# Altium schematic sheet Schematic.SchDoc
size A4; DrawnBy: Matthew Tang; Revision: 0.3; SheetNumber: 1; SheetTotal: 1; Time: Buck IC Converter Schematic
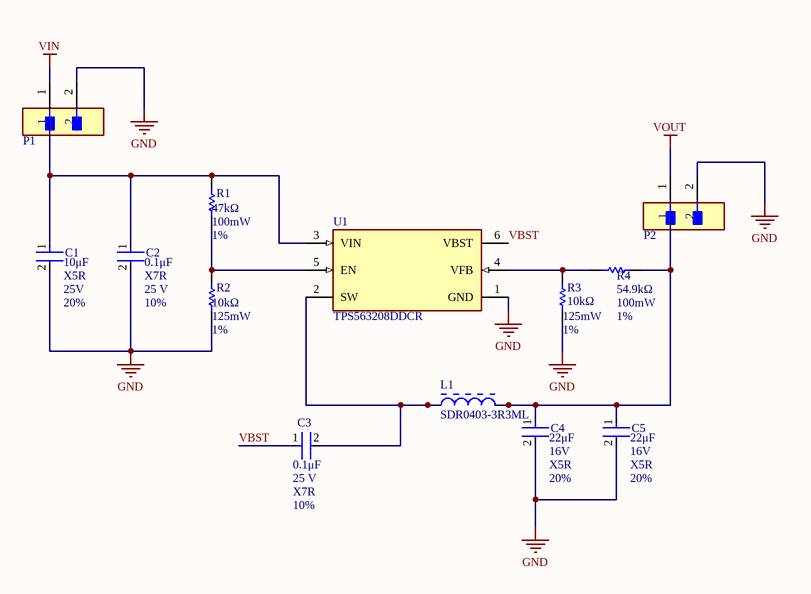
[diagram p0: Schematic.SchDoc]

## Parts
C1  10μF  Tolerance: 20%  Voltage: 25V  Dielectric: X5R  [FP-GRM188-0_2-MFG]
C2  0.1μF  Voltage Rating: 25 V  Temperature Characteristic: X7R  Tolerance: 10%  [FP-C0603C-CF-MFG]
C3  0.1μF  Voltage Rating: 25 V  Temperature Characteristic: X7R  Tolerance: 10%  [FP-C0603C-CF-MFG]
C4  22μF  Voltage Rating: 16V  Tolerance: 20%  Temperature Characteristic: X5R  [FP-CL10-IPC_B]
C5  22μF  Voltage Rating: 16V  Tolerance: 20%  Temperature Characteristic: X5R  [FP-CL10-IPC_B]
L1  SDR0403-3R3ML  [BOUR-SDR0403-2_V]
P1  (no value)  [FP-216571-1002-MFG]
P2  (no value)  [FP-216571-1002-MFG]
R1  47kΩ  Power: 100mW  Tolerance: 1%  [RESC1609X50X30NL8T20]
R2  10kΩ  Power: 125mW  Tolerance: 1%  [RESC1609X50X30NL8T20]
R3  10kΩ  Power: 125mW  Tolerance: 1%  [RESC1609X50X30NL8T20]
R4  54.9kΩ  Power: 100mW  Tolerance: 1%  [RESC1609X50X30NL8T20]
U1  TPS563208DDCR  [FP-DDC0006A-MFG]

## Nets
GND: C1.2 C2.2 C4.2 C5.2 P1.2 P2.2 R2.1 R3.1 U1.1(GND)
VIN: P1.1
VOUT: P2.1
VBST: C3.1 U1.6(VBST)
NetC1_1: C1.1 C2.1 R1.2 U1.3(VIN)
NetC3_2: C3.2 L1.1 U1.2(SW)
NetC4_1: C4.1 C5.1 L1.2 R4.1
NetR1_1: R1.1 R2.2 U1.5(EN)
NetR3_2: R3.2 R4.2 U1.4(VFB)

## Library data of the parts
C1 = CMP-2006-02520-2: Chip Multilayer Ceramic Capacitors for General Purpose, 0603, 10uF, X5R, 15%, 20%, 25V; Resistor Type: Ceramic; Max Operating Temperature: 85°C; Min Operating Temperature: -55°C; Lead Free: Lead Free; REACH SVHC: No SVHC; Case/Package: 0603; Mount: Surface Mount; Voltage Rating (DC): 25V; Height: 0.8mm; Length: 1.6mm; Thickness: 0.031inch; Width: 0.031inch; Termination: SMD/SMT; Case Code (Imperial): 0603; Case Code (Metric): 1608; Package Quantity: 1; Packaging: Tape and Reel; Depth: 0.8mm; Voltage Rating: 25V; Weight: 0.000222oz; Number of Pins: 2
C2 C3 = CMP-2006-03057-2: CAP CER 0.1UF 25V X7R 0603; Manufacturer Part Number: C0603C104K3RACTU; Manufacturer: KEMET; Value: 0.10 μF; Material: Ceramic; Temperature Coefficient: 30ppm/°C; Automotive Grade: Grade 1; Lead Free: Yes; Device Class L3: Ceramic Capacitors; Digikey Description: CAP CER 0.1UF 25V X7R 0603; Mouser Description: Multilayer Ceramic Capacitors MLCC - SMD/SMT 25volts 0.1uF X7R 10%; Package: C0603C-CF; Temperature Range Low: -55°C; Automotive: Yes; Device Class L2: Capacitors; Octopart: https://octopart.com/c0603c104k3ractu-kemet-127541; ComponentLink2Description: Datasheet; ComponentLink2URL: https://api.kemet.com/component-edge/download/datasheet/C0603C100J5GACAUTO.pdf; Temperature Range High: +125°C; RoHS: TRUE; Device Class L1: Passive Components; Category: Cap; Temperature: -55°C to +125°C; Capacitance: 0.10 μF; Height: 0.87mm
C4 C5 = CMP-13271-002755-1: Cap Ceramic 22uF 16V X5R ±20% Pad SMD 0603 +85°C T/R; Mount: Surface Mount; Packaging: Tape and Reel; Case Code (Imperial): 0603; Max Operating Temperature: 85°C; Capacitance: 22uF; Case/Package: 0603; Case Code (Metric): 1608; Min Operating Temperature: -55°C
L1 = CMP-0904-00015-1: SDR0403 Series Power Inductor, 3.3 uF +/- 20 %, 0.058 Ohm, -40 to 125 degC, 2-Pin SMD, RoHS, Tape and Reel; Manufacturer: Bourns; Inductance (uH): 3.3; SRF (MHz): 65 Min.; Test Frequency (MHz): 7.96; Q: 28; Tolerance (%): +/- 20; RDC (Ohm): 0.058 Max.; I sat (A): 3 Typ.; I rms (A): 2.15 Max.; PackageDescription: 3-Pin SMD, Dia 4.5 mm, Height 3.5 mm; PartNumber: SDR0403-3R3ML; ComponentLink1Description: Manufacturer URL; Packing: Tape and Reel; ComponentLink1URL: http://www.bourns.com/; Temperature Range: -40 to 125 degC; DatasheetVersion: Feb-12; ComponentLink2URL: http://www.bourns.com/data/global/pdfs/sdr0403.pdf; Mounting Technology: Surface Mount; ComponentLink2Description: Datasheet; PackageReference: SDR0403-2; RoHS: TRUE
P1 P2 = CMP-04776-000677-1: MICRO-FIT PLUS SR VT HDR ASSY TI
R1-R4 = CMP-1666-00005-4: Chip Resistor, 10 KOhm, +/- 1%, 100 mW, -55 to 155 degC, 0603 (1608 Metric), RoHS, Tape and Reel; Manufacturer: Vishay Semiconductor; Voltage Rating: 75 V; Max Operating Temperature: 155 degC; PackageDescription: 2-Pin Surface Mount Device, Body 1.575 x 0.85 mm; ComponentLink1Description: Manufacturer URL; RoHSCompliant: true; PackageReference: 0603; REACH SVHC: Unknown; Length: 1.55 mm; DatasheetVersion: 06/2012; Packaging: Tape and Reel; Min Operating Temperature: -55 degC; Mounting Technology: Surface Mount; ComponentLink2URL: https://datasheet.ciiva.com/11809/0900766b80d98afc-11809037.pdf; Height: 0.45 mm; ComponentLink2Description: Datasheet; Package Quantity: 5000; ComponentLink1URL: http://www.vishay.com/
U1 = CMP-04918-000356-1: IC REG BUCK ADJ 3A TSOT23-6; Min Output Voltage: 768mV; Output Configuration: Positive; Max Output Voltage: 7V; Quiescent Current: 400uA; Max Input Voltage: 17V; Min Input Voltage: 4.5V; Synchronous Rectifier: Yes; Switching Frequency: 580kHz; Number of Outputs: 1; Output Type: Adjustable; Mount: Surface Mount; Case/Package: SOT-23-6; Min Operating Temperature: -40°C; Packaging: Tape and Reel; RoHS Compliant: Yes; Output Current: 3A; Lead Free: Lead Free; Max Operating Temperature: 125°C